# Altium schematic sheet WiFiModule_Section.SchDoc
size A4; SheetNumber: 5; SheetTotal: 8
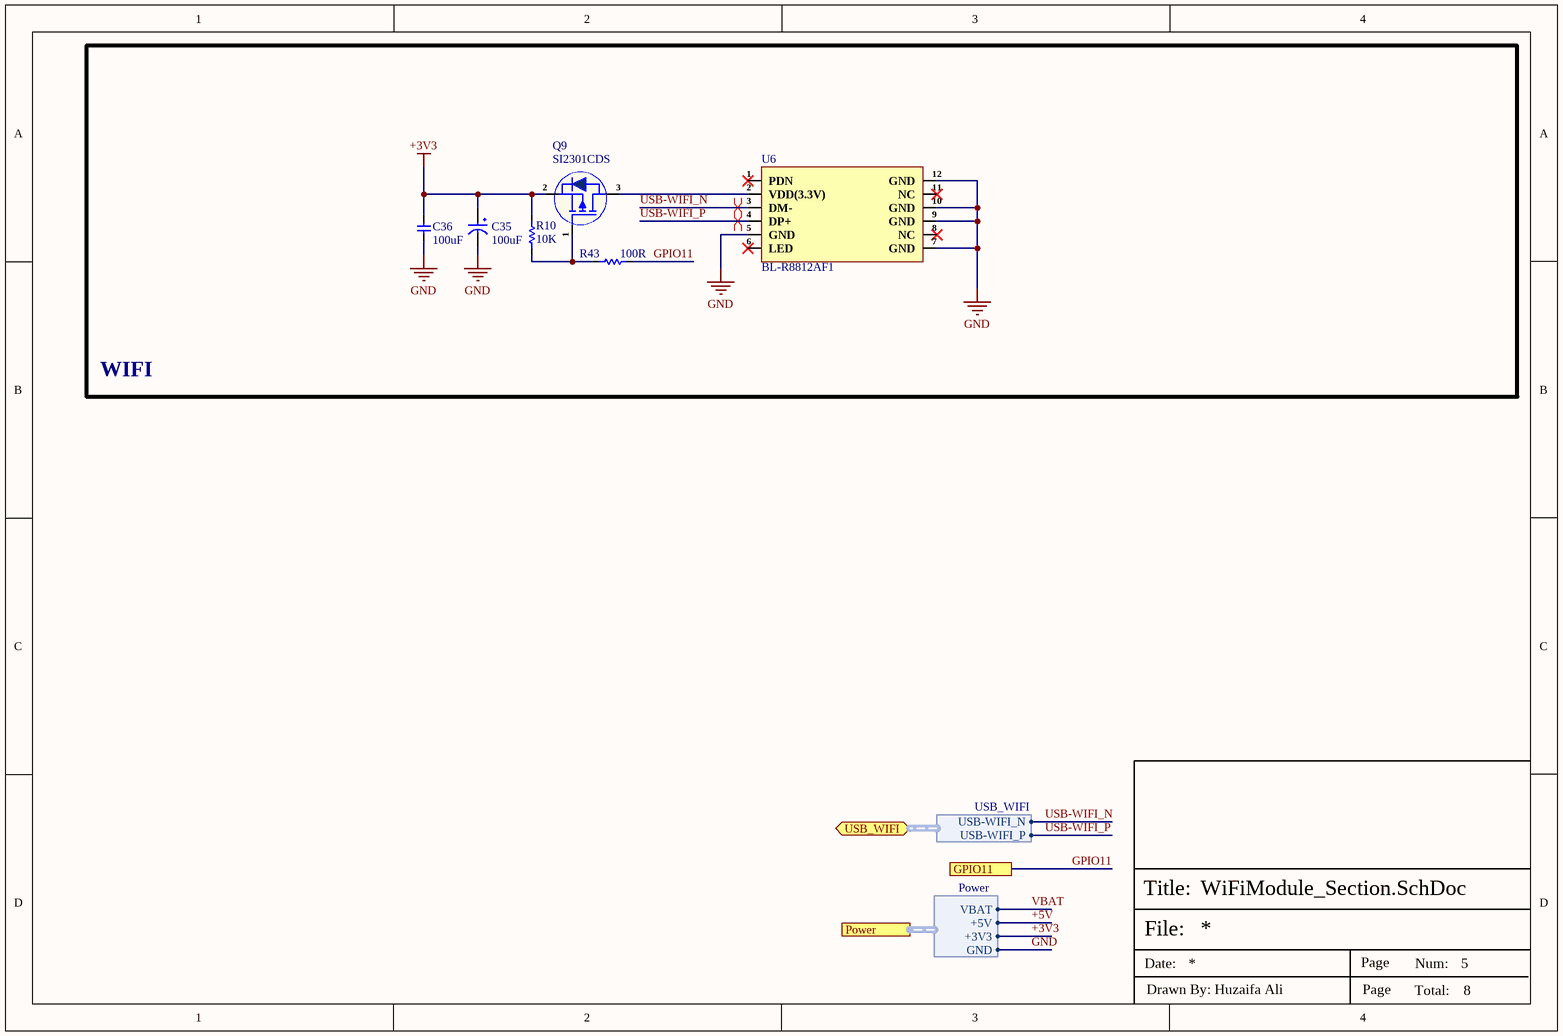
[diagram p0: WiFiModule_Section.SchDoc]

## Parts
C35  100uF  [Case-A]
C36  100uF  [Cap-1206]
Q9  SI2301CDS  [SOT-23]
R10  10K  [Res-0402]
R43  100R  [Res-0402]
U6  BL-R8812AF1  [BL-R8812AF1]

## Blocks framed on the sheet
WIFI: C35 C36 Q9 R10 R43 U6

## Ports
GPIO11 (see Top-Sheet[3B], Controller_Section[1D]), Power (harness Power, see Top-Sheet[3B], Connector_Section[4D], Controller_Section[2D], FlashMemory_Section[1D], Power_Section[3D], RTC_Section[2D], USB HUB_Section[1D]), USB_WIFI (bidir, harness USB_WIFI, see Top-Sheet[3B], USB HUB_Section[2D])

## Harnesses
Power: +5V, +3V3, GND, VBAT
USB_WIFI: USB-WIFI_N, USB-WIFI_P

## Nets
+3V3: C35.1 C36.2 Q9.2(S) R10.2 ; port Power.+3V3
GND: C35.2 C36.1 U6.5(GND) U6.7(GND) U6.9(GND) U6.10(GND) U6.12(GND) ; port Power.GND
+5V: port Power.+5V
GPIO11: R43.2 ; port GPIO11
USB-WIFI_N: U6.3(DM-) ; port USB_WIFI.USB-WIFI_N
USB-WIFI_P: U6.4(DP+) ; port USB_WIFI.USB-WIFI_P
VBAT: port Power.VBAT
NetQ9_1: Q9.1(G) R10.1 R43.1
NetQ9_3: Q9.3(D) U6.2(VDD(3.3V))

Not connected (* = marked no-connect by the designer): U6 1(PDN)* 6(LED)* 8(NC)* 11(NC)*

## Layout directives
differential pair; net class USB-WIFI; differential pair class USB_WIFI_Lines; rule Matched Net Lengths [Tolerance = 0.508mm]; rule Impedance Constraint [Min = 88.00    Max = 102.0    ]: USB-WIFI_N, USB-WIFI_P

## Notes on the sheet
- File:
- Title:
- Date:
- Page
- Num:
- Total:
- Drawn By: Huzaifa Ali

## Library data of the parts
C35 = T55A107M6R3C0150: CAP TANT POLY 100UF 6.3V 1206; Manufacturer: Vishay Sprague; Item Type: Capacitor; Supplier: Digi-Key; Supplier Part Number: 718-1988-1-ND; Manufacturer Part Number: T55A107M6R3C0150; RoHS: Yes; Category: Tantalum Capacitors; Stock: 2047; Pricing: 1=0.79, 10=0.583, 50=0.4664, 100=0.3997, 500=0.31644, 1000=0.26648 (USD); ComponentLink1URL: https://datasheet.ciiva.com/48510/t55-48510541.pdf?src-supplier=Avnet; ComponentLink1Description: https://datasheet.ciiva.com/48510/t55-48510541.pdf?src-supplier=Avnet; ComponentLink2URL: https://datasheet.ciiva.com/48510/t55-48510543.pdf?src-supplier=Avnet; ComponentLink2Description: https://datasheet.ciiva.com/48510/t55-48510543.pdf?src-supplier=Avnet; LCSC Part Number: C2158718
C36 = GRM31CR61A107MEA8L: CAP CER 100UF 10V X5R ±20% 1206 Multilayer Ceramic Capacitors MLCC - SMD/SMT ROHS; Manufacturer: Murata Electronics; Manufacturer Part Number: GRM31CR61A107MEA8L; Package: 1206; LCSC Part Number: C883598; Item Type: Capacitor; ComponentLink1Description: LCSC; ComponentLink1URL: https://www.lcsc.com/product-detail/Multilayer-Ceramic-Capacitors-MLCC-SMD-SMT_Murata-Electronics-GRM31CR61A107MEA8L_C883598.html
Q9 = SI2301CDS: null 3A 400mW 112mΩ@4.5V,2.8A 1V@250uA P Channel SOT-23 MOSFETs ROHS; Manufacturer: FUXINSEMI; Manufacturer Part Number: SI2301CDS; LCSC Part Number: C5290223; Item Type: SOT-23; ComponentLink1Description: LCSC; ComponentLink1URL: https://www.lcsc.com/product-detail/MOSFETs_FUXINSEMI-SI2301CDS_C5290223.html; Package: MOSFET
R10 = RC0402FR-0710KL: RES 10K OHM 1% 1/16W 0402; Manufacturer: Yageo; Resistance: 10kR; Voltage Rating (DC): 50V; Temperature Coefficient: 100ppm/°C; Power Rating: 62.5mW; Max Power Dissipation: 63mW; Item Type: Resistor; Supplier 1: Mouser; Manufacturer Part Number: RC0402FR-0710KL; RoHS: Yes; Category: Chip SMD Resistors; Stock 1: 18648329; Pricing 1: 1=0.10000, 10=0.01400, 50=0.01400, 100=0.00500, 1000=0.00300, 10000=0.00200 (USD); Case/Package: 0402; Number of Pins: 2; Case Code (Imperial): 0402; Case Code (Metric): 1005; Min Operating Temperature: -55°C; Max Operating Temperature: 155°C; Resistor Type: Thick Film; Tolerance: 1%; Packaging: Tape and Reel; Voltage Rating: 50V; Termination: SMD/SMT; Working Voltage: 50V; Number of Terminations: 2; Features: Moisture Resistant; Series: RC; Resistance Tolerance: 1%; Construction: Rectangular; Length: 1mm; Width: 0.5mm; Height: 0.32mm; Depth: 0.5mm; Lead Pitch: 0.2mm; REACH SVHC: No SVHC; Lead Free: Lead Free; RoHS Compliant: Yes; Military Standard: Not; ComponentLink1URL: https://datasheet.ciiva.com/7660/38568-7660787.pdf?src-supplier=Element14; ComponentLink1Description: https://datasheet.ciiva.com/7660/38568-7660787.pdf?src-supplier=Element14; ComponentLink2URL: https://datasheet.ciiva.com/7849/1686128-7849814.pdf?src-supplier=Element14; ComponentLink2Description: https://datasheet.ciiva.com/7849/1686128-7849814.pdf?src-supplier=Element14; ComponentLink3URL: https://datasheet.ciiva.com/7983/1018594-7983486.pdf?src-supplier=Element14; ComponentLink3Description: https://datasheet.ciiva.com/7983/1018594-7983486.pdf?src-supplier=Element14; ComponentLink4URL: https://datasheet.ciiva.com/22747/1018594-22747512.pdf?src-supplier=Element14; ComponentLink4Description: https://datasheet.ciiva.com/22747/1018594-22747512.pdf?src-supplier=Element14; ComponentLink5URL: https://datasheet.ciiva.com/12667/pyu-rc0402-51-rohs-l-6-r-12667067.pdf?src-supplier=Mouser; ComponentLink5Description: https://datasheet.ciiva.com/12667/pyu-rc0402-51-rohs-l-6-r-12667067.pdf?src-supplier=Mouser; ComponentLink6URL: https://datasheet.ciiva.com/7849/1784430-7849813.pdf?src-supplier=Element14; ComponentLink6Description: https://datasheet.ciiva.com/7849/1784430-7849813.pdf?src-supplier=Element14; ComponentLink7URL: https://datasheet.ciiva.com/7849/1784430-7849815.pdf?src-supplier=Element14; ComponentLink7Description: https://datasheet.ciiva.com/7849/1784430-7849815.pdf?src-supplier=Element14; Supplier Part Number 1: 603-RC0402FR-0710KL; LCSC Part Number: C60490
R43 = RC0402FR-07100RL: RES 100 OHM 1% 1/16W 0402; Manufacturer: Yageo; Power Rating: 62.5mW; Voltage Rating: 50V; Temperature Coefficient: 100ppm/°C; Max Power Dissipation: 63mW; Item Type: Resistor; Supplier 1: Mouser; Manufacturer Part Number: RC0402FR-07100RL; RoHS: Yes; Category: Chip SMD Resistors; Stock 1: 699545; Pricing 1: 1=0.10000, 10=0.01200, 50=0.01200, 100=0.00500, 1000=0.00300, 2500=0.00200, 10000=0.00100 (USD); Case/Package: 0402; Number of Pins: 2; Case Code (Imperial): 0402; Case Code (Metric): 1005; Size Code: 0402; Min Operating Temperature: -55°C; Max Operating Temperature: 155°C; Tolerance: 1%; Voltage Rating (DC): 50V; Resistance: 100R; Packaging: Tape and Reel; Termination: SMD/SMT; Resistor Type: Thick Film; Features: Moisture Resistant; Series: RC; Number of Terminations: 2; Resistance Tolerance: 1%; Construction: Rectangular; Technology: THICK FILM; Length: 1mm; Width: 0.5mm; Height: 0.32mm; Depth: 0.5mm; RoHS Compliant: Yes; REACH SVHC: No SVHC; Military Standard: Not; Lead Free: Lead Free; ComponentLink1URL: https://datasheet.ciiva.com/11808/0900766b80c66297-11808765.pdf?src-supplier=RSComponents; ComponentLink1Description: https://datasheet.ciiva.com/11808/0900766b80c66297-11808765.pdf?src-supplier=RSComponents; ComponentLink2URL: https://datasheet.ciiva.com/7849/1784430-7849810.pdf?src-supplier=Element14; ComponentLink2Description: https://datasheet.ciiva.com/7849/1784430-7849810.pdf?src-supplier=Element14; ComponentLink3URL: https://datasheet.ciiva.com/28367/1018594-28367226.pdf?src-supplier=Element14; ComponentLink3Description: https://datasheet.ciiva.com/28367/1018594-28367226.pdf?src-supplier=Element14; ComponentLink4URL: https://datasheet.ciiva.com/22747/1018594-22747511.pdf?src-supplier=Element14; ComponentLink4Description: https://datasheet.ciiva.com/22747/1018594-22747511.pdf?src-supplier=Element14; ComponentLink5URL: https://datasheet.ciiva.com/12667/pyu-rc0402-51-rohs-l-6-r-12667957.pdf?src-supplier=Mouser; ComponentLink5Description: https://datasheet.ciiva.com/12667/pyu-rc0402-51-rohs-l-6-r-12667957.pdf?src-supplier=Mouser; ComponentLink6URL: https://datasheet.ciiva.com/15189/getdatasheetpartid-329466-15189335.pdf?src-supplier=Verical; ComponentLink6Description: https://datasheet.ciiva.com/15189/getdatasheetpartid-329466-15189335.pdf?src-supplier=Verical; ComponentLink7URL: https://datasheet.ciiva.com/16740/pyu-rc0402-51-rohs-l-6-r-16740566.pdf?src-supplier=Future+Electronics; ComponentLink7Description: https://datasheet.ciiva.com/16740/pyu-rc0402-51-rohs-l-6-r-16740566.pdf?src-supplier=Future+Electronics; Supplier Part Number 1: 603-RC0402FR-07100RL; LCSC Part Number: C106232
U6 = BL-R8812AF1: Intelligent WiFiI Module 1200M Dual Band+AC (High Power); Manufacturer: *; Manufacturer Part Number: BL-R8812AF1; ComponentLink1Description: Aliexpress; ComponentLink1URL: https://www.aliexpress.com/item/1005005638445796.html?spm=a2g0o.order_list.order_list_main.29.65f179d27FZF0V&gatewayAdapt=glo2nld; Item Type: Module